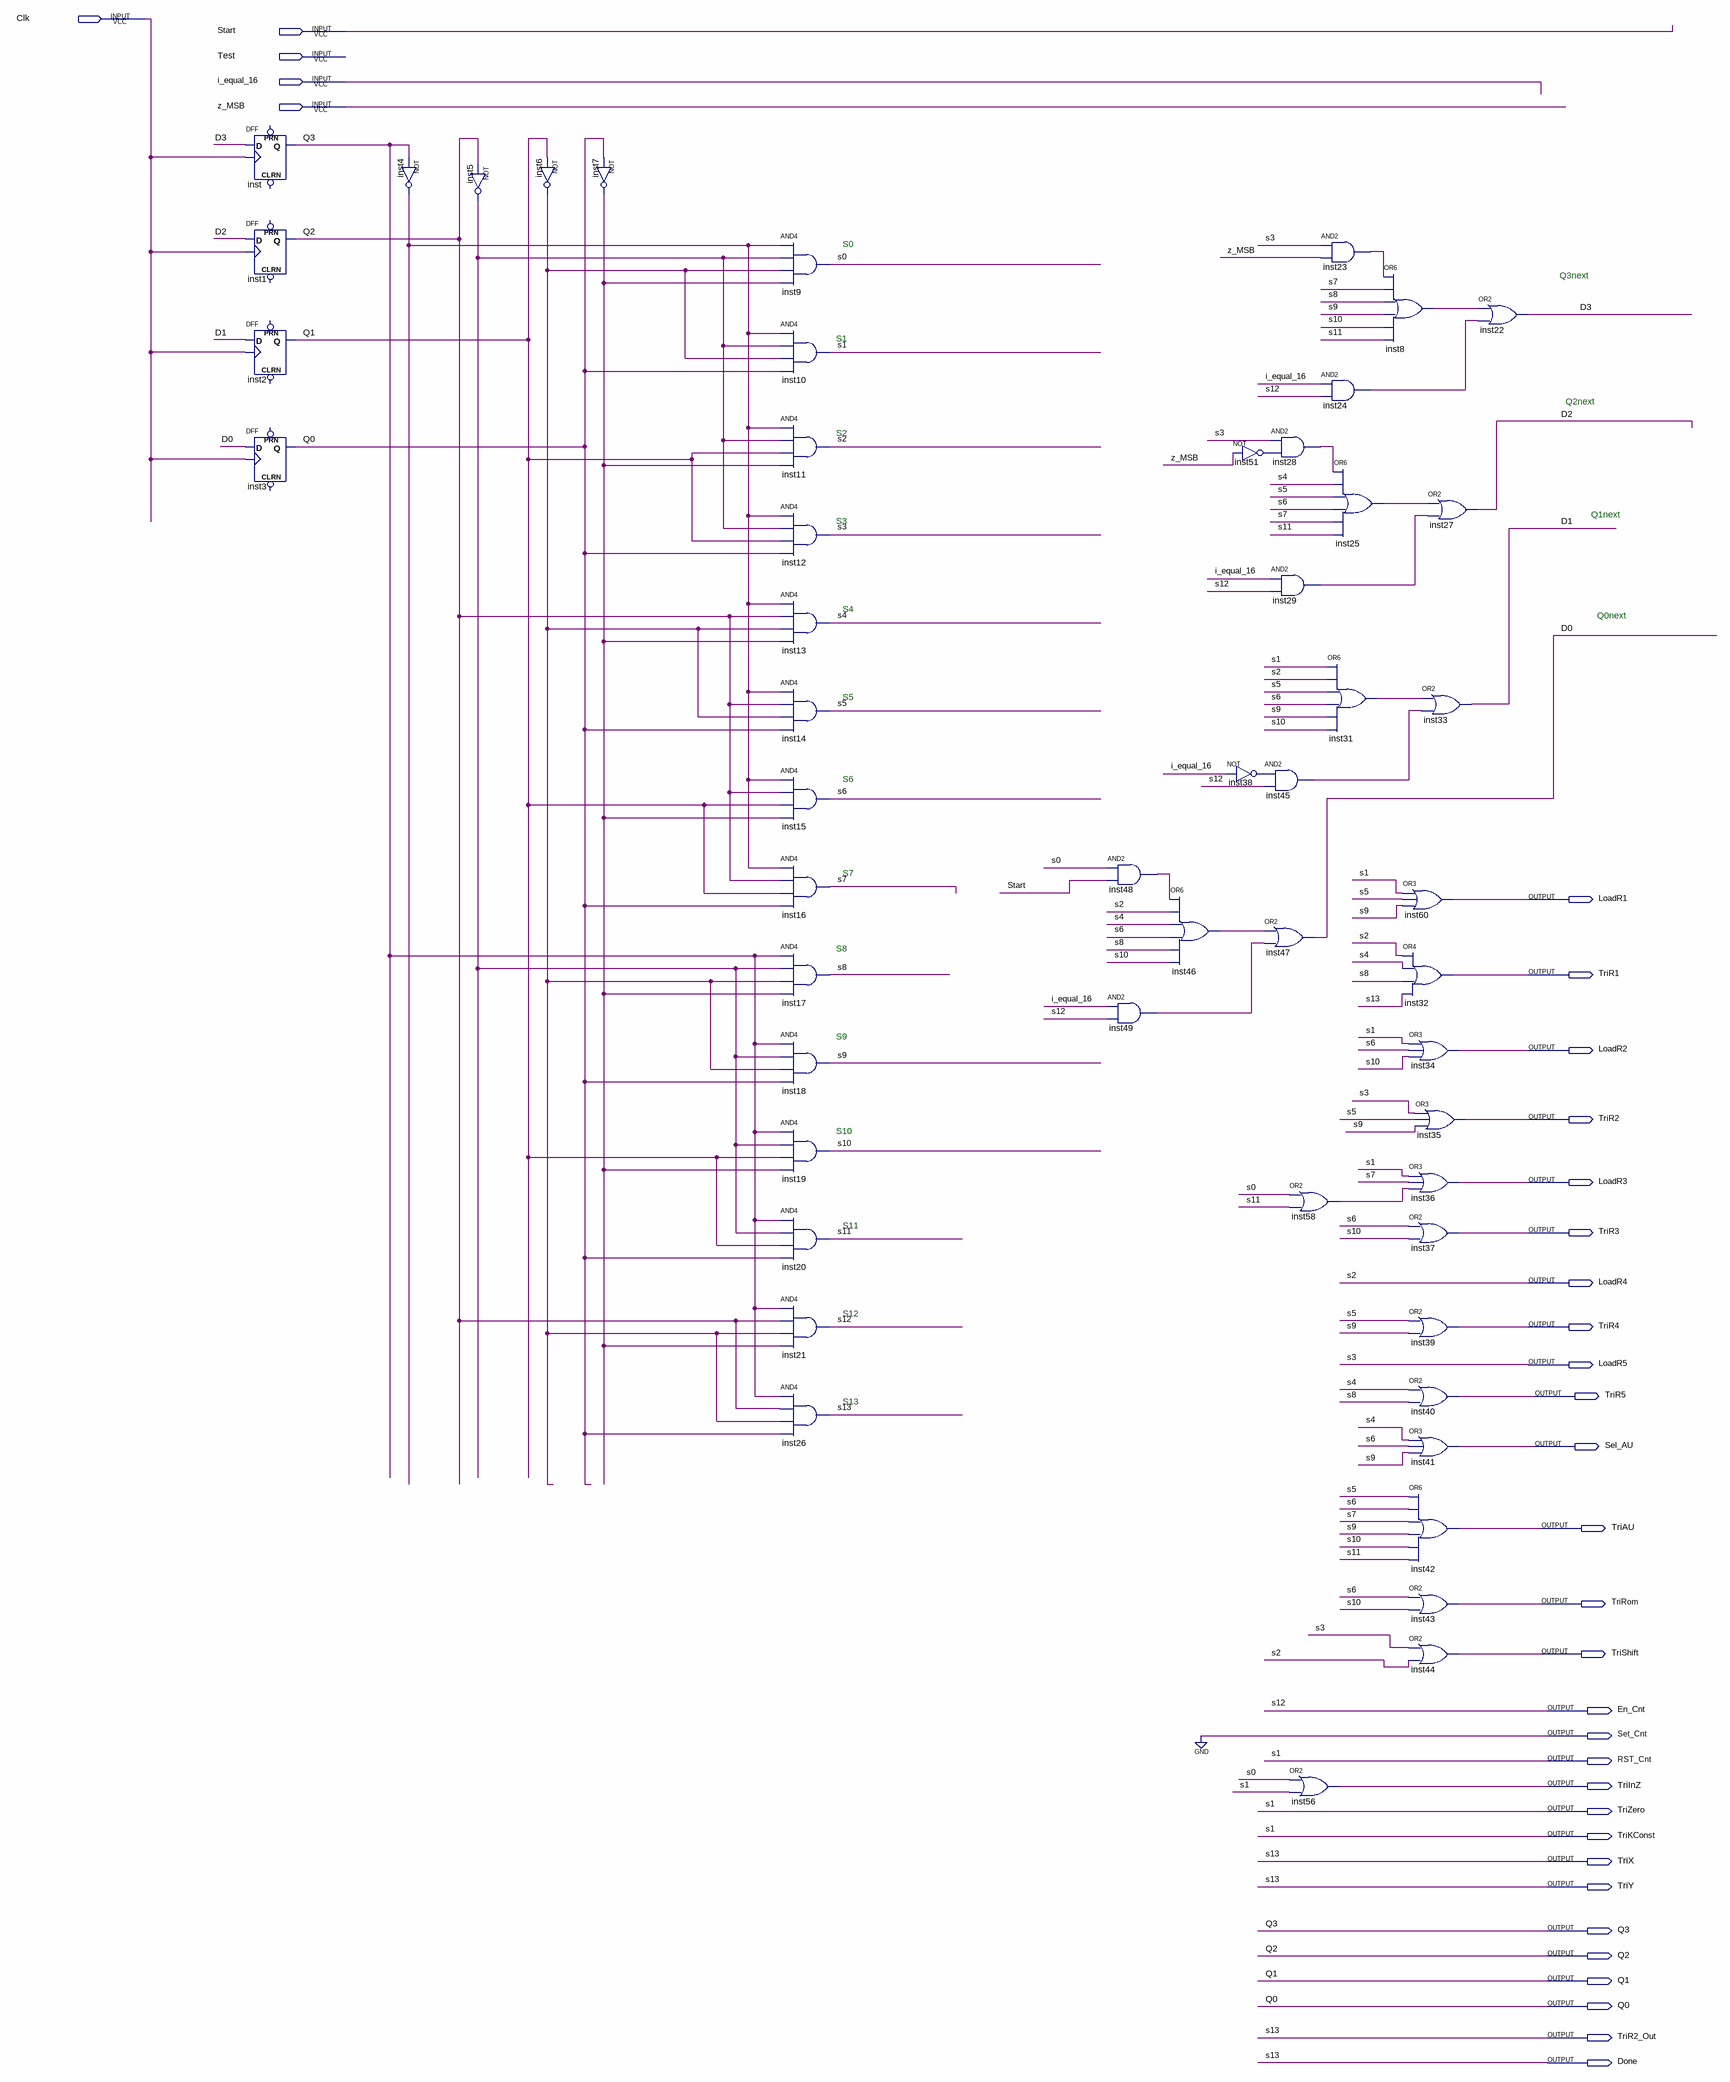
[diagram p0: schematic sheet]
// Quartus schematic control_pipeline_AU.bdf as structural Verilog: 53 symbols, 33 pins
module control_pipeline_AU (
  input  Clk,
  input  Start,
  input  Test,
  input  i_equal_16,
  input  z_MSB,
  output LoadR1,
  output TriR1,
  output LoadR2,
  output TriR2,
  output LoadR3,
  output TriR3,
  output LoadR4,
  output TriR4,
  output LoadR5,
  output TriR5,
  output Sel_AU,
  output TriAU,
  output TriRom,
  output TriShift,
  output En_Cnt,
  output Set_Cnt,
  output RST_Cnt,
  output TriInZ,
  output TriZero,
  output TriKConst,
  output TriX,
  output TriY,
  output Q3,
  output Q2,
  output Q1,
  output Q0,
  output TriR2_Out,
  output Done
);

  wire D0, D1, D2, D3, inst4_out, inst5_out, inst6_out, inst7_out, inst8_out, inst23_out, inst24_out,
       inst25_out, inst28_out, inst29_out, inst31_out, inst38_out, inst45_out, inst46_out, inst48_out,
       inst49_out, inst51_out, inst58_out, s0, s4, s5, s6, s7, s8, s9, s10, s11;

  DFF inst (.CLK(Clk), .D(D3), .Q(Q3));  // open: CLRN, PRN
  DFF inst1 (.CLK(Clk), .D(D2), .Q(Q2));  // open: CLRN, PRN
  DFF inst2 (.CLK(Clk), .D(D1), .Q(Q1));  // open: CLRN, PRN
  DFF inst3 (.CLK(Clk), .D(D0), .Q(Q0));  // open: CLRN, PRN
  not inst4 (inst4_out, Q3);
  not inst5 (inst5_out, Q2);
  not inst6 (inst6_out, Q1);
  not inst7 (inst7_out, Q0);
  and inst9 (s0, inst4_out, inst5_out, inst6_out, inst7_out);
  and inst10 (RST_Cnt, inst4_out, inst5_out, inst6_out, Q0);
  and inst11 (LoadR4, inst4_out, inst5_out, Q1, inst7_out);
  and inst12 (LoadR5, inst4_out, inst5_out, Q1, Q0);
  and inst13 (s4, inst4_out, Q2, inst6_out, inst7_out);
  and inst14 (s5, inst4_out, Q2, inst6_out, Q0);
  and inst15 (s6, inst4_out, Q2, Q1, inst7_out);
  and inst16 (s7, inst4_out, Q2, Q1, Q0);
  and inst17 (s8, Q3, inst5_out, inst6_out, inst7_out);
  and inst18 (s9, Q3, inst5_out, inst6_out, Q0);
  and inst19 (s10, Q3, inst5_out, Q1, inst7_out);
  and inst20 (s11, Q3, inst5_out, Q1, Q0);
  and inst21 (En_Cnt, Q3, Q2, inst6_out, inst7_out);
  and inst26 (Done, Q3, Q2, inst6_out, Q0);
  and inst48 (inst48_out, s0, Start);
  and inst49 (inst49_out, i_equal_16, En_Cnt);
  or inst46 (inst46_out, inst48_out, LoadR4, s4, s6, s8, s10);
  not inst51 (inst51_out, z_MSB);
  not inst38 (inst38_out, i_equal_16);
  and inst28 (inst28_out, LoadR5, inst51_out);
  and inst29 (inst29_out, i_equal_16, En_Cnt);
  and inst45 (inst45_out, inst38_out, En_Cnt);
  or inst47 (D0, inst46_out, inst49_out);
  and inst23 (inst23_out, LoadR5, z_MSB);
  and inst24 (inst24_out, i_equal_16, En_Cnt);
  or inst25 (inst25_out, inst28_out, s4, s5, s6, s7, s11);
  or inst31 (inst31_out, RST_Cnt, LoadR4, s5, s6, s9, s10);
  or inst58 (inst58_out, s0, s11);
  or inst56 (TriInZ, s0, RST_Cnt);
  or inst8 (inst8_out, inst23_out, s7, s8, s9, s10, s11);
  or inst27 (D2, inst25_out, inst29_out);
  or inst33 (D1, inst31_out, inst45_out);
  or inst60 (LoadR1, RST_Cnt, s5, s9);
  or inst32 (TriR1, LoadR4, s4, s8, Done);
  or inst34 (LoadR2, RST_Cnt, s6, s10);
  or inst35 (TriR2, LoadR5, s5, s9);
  or inst36 (LoadR3, RST_Cnt, s7, inst58_out);
  or inst37 (TriR3, s6, s10);
  or inst39 (TriR4, s5, s9);
  or inst40 (TriR5, s4, s8);
  or inst41 (Sel_AU, s4, s6, s9);
  or inst42 (TriAU, s5, s6, s7, s9, s10, s11);
  or inst43 (TriRom, s6, s10);
  or inst44 (TriShift, LoadR5, LoadR4);
  or inst22 (D3, inst8_out, inst24_out);

  assign Set_Cnt = 1'b0;
  assign TriKConst = RST_Cnt;
  assign TriR2_Out = Done;
  assign TriX = Done;
  assign TriY = Done;
  assign TriZero = RST_Cnt;

  // Other names for the same wires on the sheet: s1 = RST_Cnt; s2 = LoadR4; s3 = LoadR5; s12 = En_Cnt; s13 = Done

  // Notes on the sheet:
  //   S0
  //   Q3next
  //   S1
  //   Q2next
  //   S2
  //   Q1next
  //   S3
  //   S4
  //   Q0next
  //   S5
  //   S6
  //   S7
  //   S8
  //   S9
  //   S10
  //   S11
  //   S12
  //   S13
endmodule
